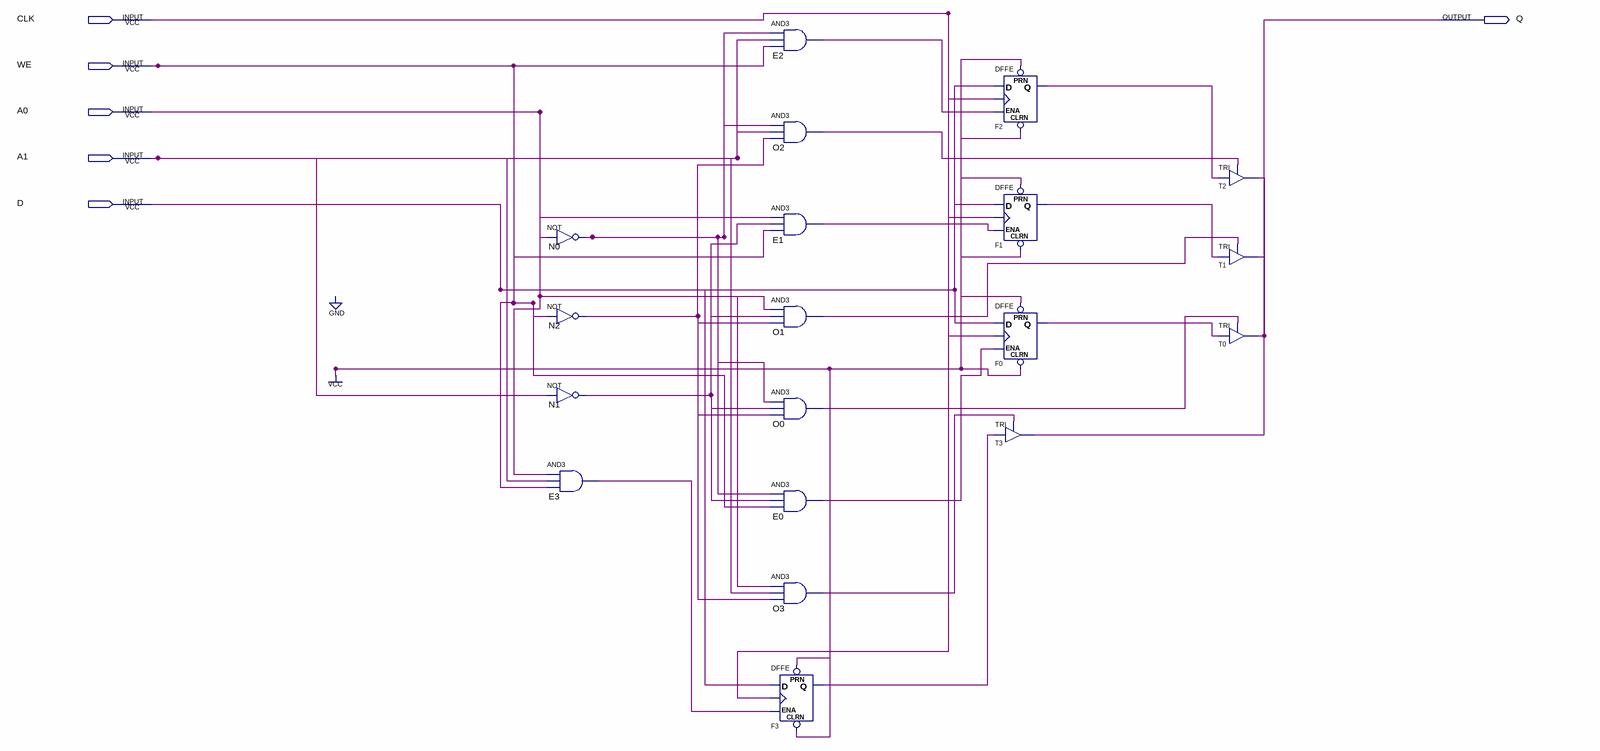
[diagram p0: schematic sheet]
// Quartus schematic ram4.bdf as structural Verilog: 19 symbols, 6 pins
module ram4 (
  input  CLK,
  input  WE,
  input  A0,
  input  A1,
  input  D,
  output Q
);

  wire E0_out, E1_out, E2_out, E3_out, F0_q, F1_q, F2_q, F3_q, N0_out, N1_out, N2_out, O0_out, O1_out,
       O2_out, O3_out;

  not N0 (N0_out, A0);
  not N2 (N2_out, WE);
  not N1 (N1_out, A1);
  and E3 (E3_out, A0, A1, WE);
  and E2 (E2_out, N0_out, A1, WE);
  and O2 (O2_out, N0_out, A1, N2_out);
  and E1 (E1_out, A0, N1_out, WE);
  and O1 (O1_out, A0, N1_out, N2_out);
  and O0 (O0_out, N0_out, N1_out, N2_out);
  and E0 (E0_out, N0_out, N1_out, WE);
  and O3 (O3_out, A0, A1, N2_out);
  DFFE F3 (.PRN(1'b1), .CLRN(1'b1), .D(D), .CLK(CLK), .ENA(E3_out), .Q(F3_q));
  DFFE F2 (.PRN(1'b1), .CLRN(1'b1), .D(D), .CLK(CLK), .ENA(E2_out), .Q(F2_q));
  DFFE F1 (.PRN(1'b1), .CLRN(1'b1), .D(D), .CLK(CLK), .ENA(E1_out), .Q(F1_q));
  DFFE F0 (.PRN(1'b1), .CLRN(1'b1), .D(D), .CLK(CLK), .ENA(E0_out), .Q(F0_q));
  TRI T3 (.IN(F3_q), .OE(O3_out), .OUT(Q));
  TRI T2 (.IN(F2_q), .OE(O2_out), .OUT(Q));
  TRI T1 (.IN(F1_q), .OE(O1_out), .OUT(Q));
  TRI T0 (.IN(F0_q), .OE(O0_out), .OUT(Q));
endmodule
